# Altium project DC Electronic Load Power MOSFETS.PrjPcb
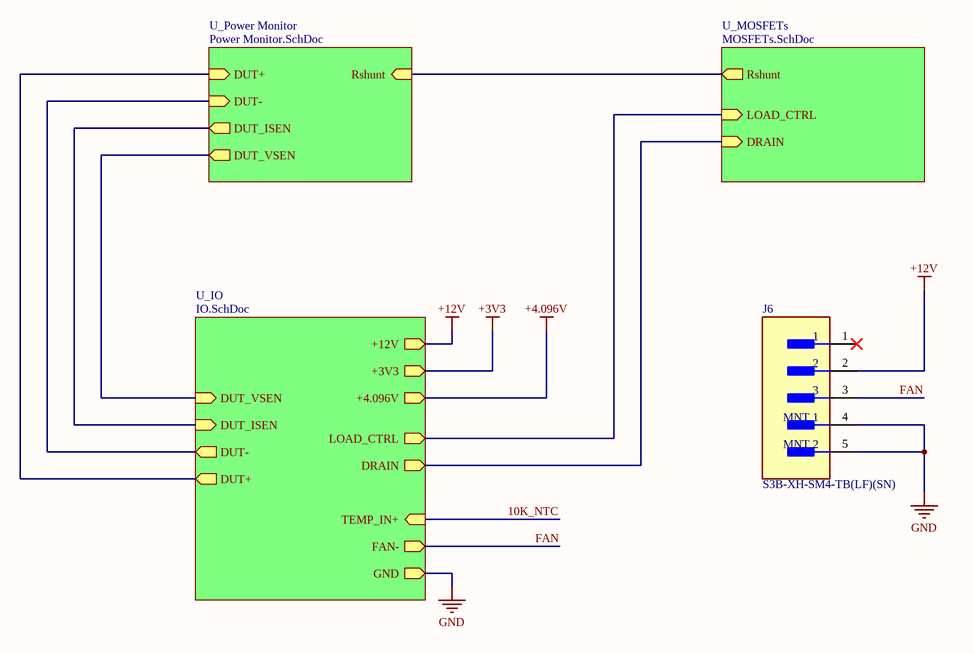
[diagram p0: Top.SchDoc]
4 sheets, 38 parts. Net scope: hierarchical (ports join the sheet entries above them; power ports are global).
Board file: Power Electronics.PcbDoc
Sheets:
  Top.SchDoc
    U_IO = IO.SchDoc
    U_Power Monitor = Power Monitor.SchDoc
    U_MOSFETs = MOSFETs.SchDoc

## Sheet Top.SchDoc
size B; SheetNumber: 1; SheetTotal: 4

### Parts
J6  S3B-XH-SM4-TB(LF)(SN)  [FP-S3B-XH-SM4-TB_LF_SN-MFG]

### Sub-sheets
U_IO = IO.SchDoc: DRAIN (out), DUT+ (out), DUT- (out), DUT_VSEN (in), DUT_ISEN (in), LOAD_CTRL (out), FAN- (out), TEMP_IN+ (in), +4.096V (out), +3V3 (out), +12V (out), GND (out)
U_MOSFETs = MOSFETs.SchDoc: DRAIN (in), LOAD_CTRL (in), Rshunt (out)
U_Power Monitor = Power Monitor.SchDoc: DUT+ (in), DUT- (in), DUT_VSEN (out), DUT_ISEN (out), Rshunt (in)

### Nets
+12V: J6.2 ; sheet U_IO/+12V
GND: J6.4(MNT_1) J6.5(MNT_2) ; sheet U_IO/DUT-, sheet U_IO/GND, sheet U_Power Monitor/DUT-
DUT Input: sheet U_IO/DUT+, sheet U_Power Monitor/DUT+
DUT_ISEN_P: sheet U_Power Monitor/Rshunt, sheet U_MOSFETs/Rshunt
FAN: J6.3 ; sheet U_IO/FAN-
NetP1_5: sheet U_IO/DUT_ISEN, sheet U_Power Monitor/DUT_ISEN
NetP1_6: sheet U_IO/LOAD_CTRL, sheet U_MOSFETs/LOAD_CTRL
NetP1_10: sheet U_IO/DUT_VSEN, sheet U_Power Monitor/DUT_VSEN
NetQ1_2: sheet U_IO/DRAIN, sheet U_MOSFETs/DRAIN

Not connected (* = marked no-connect by the designer): J6 1*

### Library data of the parts
J6 = CMP-17439-000066-1: CONN HEADER SMD R/A 3POS 2.5MM; Number of Positions: 3; Max Current Rating: 3A; Gender: Male; Max Voltage Rating (AC): 250V; Contact Resistance: 20mR; Connector Type: Male Pin; Max Operating Temperature: 85°C; Orientation: Right Angle; Series: XH; Number of Rows: 1; Housing Material: Polyamide; Packaging: Tape and Reel; Number of Contacts: 3; REACH SVHC: No SVHC; Housing Color: Beige; Mount: Surface Mount; Contact Material: Copper Alloy; Package Quantity: 1; Color: Natural; Min Operating Temperature: -25°C; Termination: Solder; Fastening Type: Detent; Pitch: 2.5mm; Lead Free: Lead Free; Length: 12.5mm; Depth: 10mm; Contact Plating: Tin; Contact Type: Male Pin

## Sheet IO.SchDoc
size B; SheetNumber: 4; SheetTotal: 4
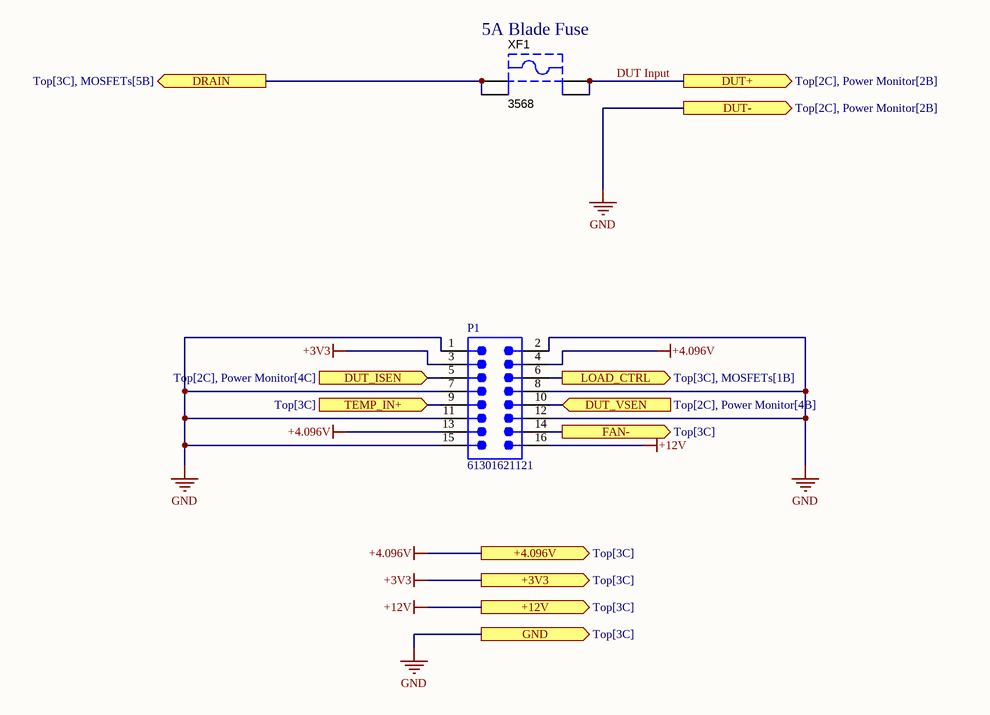
[diagram p1: IO.SchDoc]

### Parts
P1  61301621121  [61301621121]
XF1  3568  [KSTN-3568_V]

### Ports
+3V3 (out, see Top[3C]), +4.096V (out, see Top[3C]), +12V (out, see Top[3C]), DRAIN (out, see Top[3C], MOSFETs[5B]), DUT+ (out, see Top[2C], Power Monitor[2B]), DUT- (out, see Top[2C], Power Monitor[2B]), DUT_ISEN (in, see Top[2C], Power Monitor[4C]), DUT_VSEN (in, see Top[2C], Power Monitor[4B]), FAN- (out, see Top[3C]), GND (out, see Top[3C]), LOAD_CTRL (out, see Top[3C], MOSFETs[1B]), TEMP_IN+ (in, see Top[3C])

### Nets
+3V3: P1.3 ; port +3V3
+4.096V: P1.4 P1.13 ; port +4.096V
+12V: P1.16 ; port +12V
GND: P1.1 P1.2 P1.7 P1.8 P1.11 P1.12 P1.15 ; port DUT-, port GND
10K_NTC: P1.9 ; port TEMP_IN+
DUT Input: XF1.3 XF1.4 ; port DUT+
FAN: P1.14 ; port FAN-
NetP1_5: P1.5 ; port DUT_ISEN
NetP1_6: P1.6 ; port LOAD_CTRL
NetP1_10: P1.10 ; port DUT_VSEN
NetQ1_2: XF1.1 XF1.2 ; port DRAIN

### Notes on the sheet
- (near XF1) 5A Blade Fuse

### Library data of the parts
P1 = CMP-1502-01097-3: NexarPartId: 32855550; Contact Resistance: 20mΩ; Operating Supply Voltage: 250V; Number of Contacts: 16; Current Rating: 3A; Connector Type: Male Pin; Row Spacing: 2.54mm; Gender: Male; Min Operating Temperature: -40°C; Contact Material: Copper; RoHS: Compliant; Lead Pitch: 2.54mm; Color: Black; Contact Mating Length: 5.9944mm; REACH SVHC: Unknown; Number of Rows: 2; Orientation: Vertical; Number of Positions: 16; Max Operating Temperature: 105°C; Termination: Solder; Packaging: Bulk; Height: 8.89mm; Mount: Through Hole; Contact Plating: Gold; Voltage Rating: 250V; Number of Pins: 16; Pitch: 2.54mm
XF1 = CMP-2000-05464-1: JLCPCB: / C19727305 / Fuse Holder, 20 A, 500 V, -50 to 145 degC, 4-Pin THD, RoHS; Manufacturer: Keystone; Package Reference: 3568; Datasheet Version: 04/2013; Datasheet URL: https://datasheet.ciiva.com/16294/m60-2p40-16294706.pdf; Manufacturer URL: http://www.keyelco.com/; Mounting Technology: ThroughHole; Package Description: 4-Pin Through Hole Device, Body 16 x 6.73 mm, Pitch 9.9 mm

## Sheet Power Monitor.SchDoc
size B; SheetNumber: 3; SheetTotal: 4
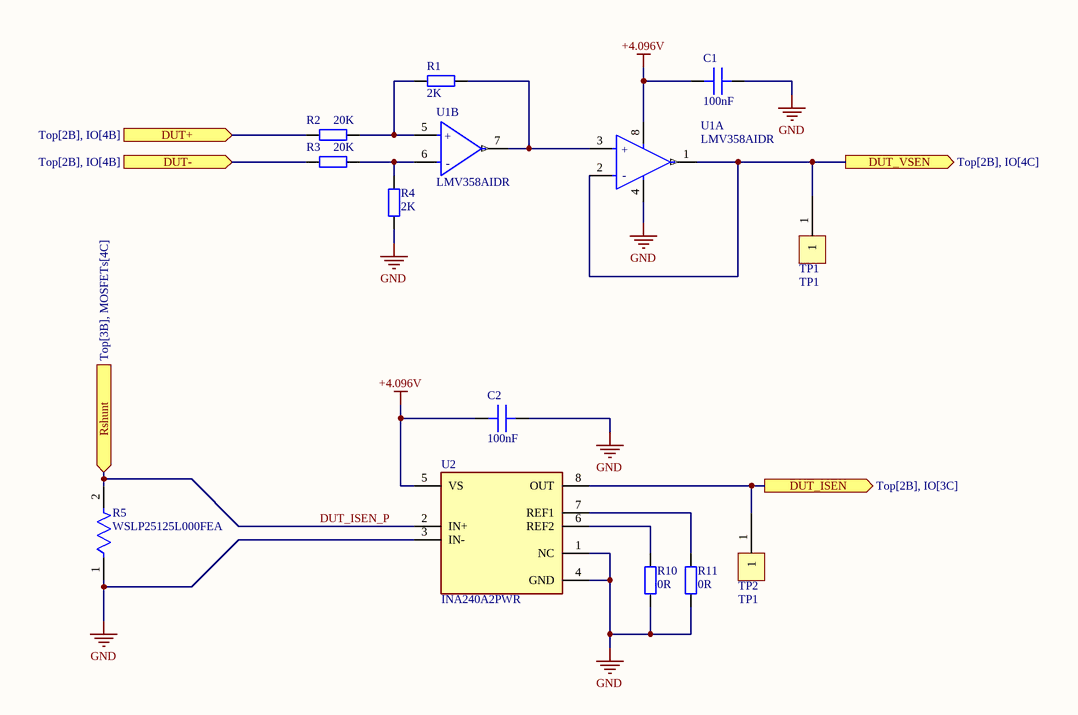
[diagram p2: Power Monitor.SchDoc]

### Parts
C1  100nF  [IPC C C0402 NO SILK]
C2  100nF  [IPC C C0402 NO SILK]
R1  2K  [IPC C R0603 NO SILK]
R2  20K  [IPC C R0603 NO SILK]
R3  20K  [IPC C R0603 NO SILK]
R4  2K  [IPC C R0603 NO SILK]
R5  WSLP25125L000FEA  [FP-WSLP2512-0R005-0R0069-MFG]
R10  0R  [IPC C R0603 NO SILK]
R11  0R  [IPC C R0603 NO SILK]
TP1  TP1  [TP1]
TP2  TP1  [TP1]
U1  LMV358AIDR  [FP-D0008A-IPC_C]  (parts A,B of 2)
U2  INA240A2PWR  [FP-PW0008A-MFG]

### Ports
DUT+ (in, see Top[2B], IO[4B]), DUT- (in, see Top[2B], IO[4B]), DUT_ISEN (out, see Top[2B], IO[3C]), DUT_VSEN (out, see Top[2B], IO[4C]), Rshunt (in, see Top[3B], MOSFETs[4C])

### Nets
+4.096V: C1.2 C2.2 U1.8(V+) U2.5(VS)
GND: C1.1 C2.1 R3.1 R4.2 R5.1 R10.1 R11.1 U1.4(V-) U2.1(NC) U2.3(IN-) U2.4(GND) ; port DUT-
DUT Input: R2.1 ; port DUT+
DUT_ISEN_P: R5.2 U2.2(IN+) ; port Rshunt
NetP1_5: TP2.1 U2.8(OUT) ; port DUT_ISEN
NetP1_10: TP1.1 U1.1(OUT_A) U1.2(-IN_A) ; port DUT_VSEN
NetR1_1: R1.1 R2.2 U1.5(+IN_B)
NetR1_2: R1.2 U1.3(+IN_A) U1.7(OUT_B)
NetR3_2: R3.2 R4.1 U1.6(-IN_B)
NetR10_2: R10.2 U2.6(REF2)
NetR11_2: R11.2 U2.7(REF1)

### Notes on the sheet
- (in symbol CMP-04895-000233-1, part A) +; -
- (in symbol CMP-04895-000233-1, part B) +; -

### Library data of the parts
C1 C2 = CMP-002-000000-1: Source: Schlib1.SchLib; Design Item ID: Generic CAP 0402; Value: 100nF
R1 R4 R10 R11 = CMP-008-000001-2: Generic RES 0603; Design Item ID: Generic RES 0603; Source: Schlib1.SchLib
  R1 R4: Value: 2K
  R10 R11: Value: 0R
R2 R3 = CMP-008-000001-2: Generic RES 0603 / C136942; Value: 20K; Design Item ID: Generic RES 0603; Source: Schlib1.SchLib
R5 = CMP-00030-22061781-1: WSLP25125L000FEA Res Metal Strip 2512 0.005 Ohm 1% 3W ±110ppm/C Sulfur Resistant Pad SMD Automotive T/R; Temperature Coefficient: 110ppm/°C; Resistance: 5mΩ; Max Operating Temperature: 170°C; Height: 635µm; Composition: Metal Element, Metal Strip; Power Rating: 3W; Case Code (Metric): 6432; Width: 3.2mm; Packaging: Cut Tape; Mount: Surface Mount; Lead Free: Lead Free; Case/Package: 2512; Termination: SMD/SMT; Length: 6.4mm; REACH SVHC: Unknown; Tolerance: 1%; NexarPartId: 22061781; Schedule B: 8533210045, 8533210045; RoHS: Compliant; Min Operating Temperature: -65°C; Case Code (Imperial): 2512
TP1 TP2 = CMP-00003-3: Testpoint double sided
U1 = CMP-04895-000233-1: IC OPAMP GP 2 CIRCUIT 8SOIC / C182039; Gain Bandwidth Product: 1MHz; Number of Channels: 2; Input Offset Voltage (Vos): 1mV; Operating Supply Current: 80uA; Input Bias Current: 10pA; Slew Rate: 1.7V/µs; Min Operating Temperature: -40°C; Number of Circuits: 2; Packaging: Cut Tape; Case/Package: SOIC; RoHS Compliant: Yes; Number of Pins: 8; Mount: Surface Mount; Max Operating Temperature: 125°C
U2 = CMP-04895-000047-1: IC AMP CURRENT SENSE 8-TSSOP; Manufacturer: Texas Instruments; Voltage Gain: 0.05V/mV; Max Supply Voltage: 5.5V; Max Junction Temp: +150°C; Input Offset Voltage: 0.005mV; Bandwidth: 400kHz; Min Supply Voltage: 2.7V; Nominal Supply Current: 1.8mA; Standoff Height: 0.05mm; Number Of Channels: 1; Input Bias Current: 90uA; ComponentLink2URL: http://www.ti.com/lit/ds/symlink/ina240.pdf; Device Class L2: Linear ICs; ComponentLink2Description: Datasheet; Temperature: -40°C to +125°C; Octopart: https://octopart.com/ina240a2pwr-texas+instruments-75431049; Automotive: No; Manufacturer Part Number: INA240A2PWR; Ambient Temperature Range Low: -40°C; RoHS: TRUE; Package: PW0008A; Device Class L1: Integrated Circuits (ICs); Temperature Range Low: -40°C; Category: IC; Ipc Land Pattern Name: SOP65P300X120-8; Temperature Range High: +125°C; Ambient Temperature Range High: +125°C; Height: 1.2mm; Lead Free: Yes; Device Class L3: Instrumentation; Digikey Description: IC AMP CURRENT SENSE 8-TSSOP

## Sheet MOSFETs.SchDoc
size B; SheetNumber: 2; SheetTotal: 4
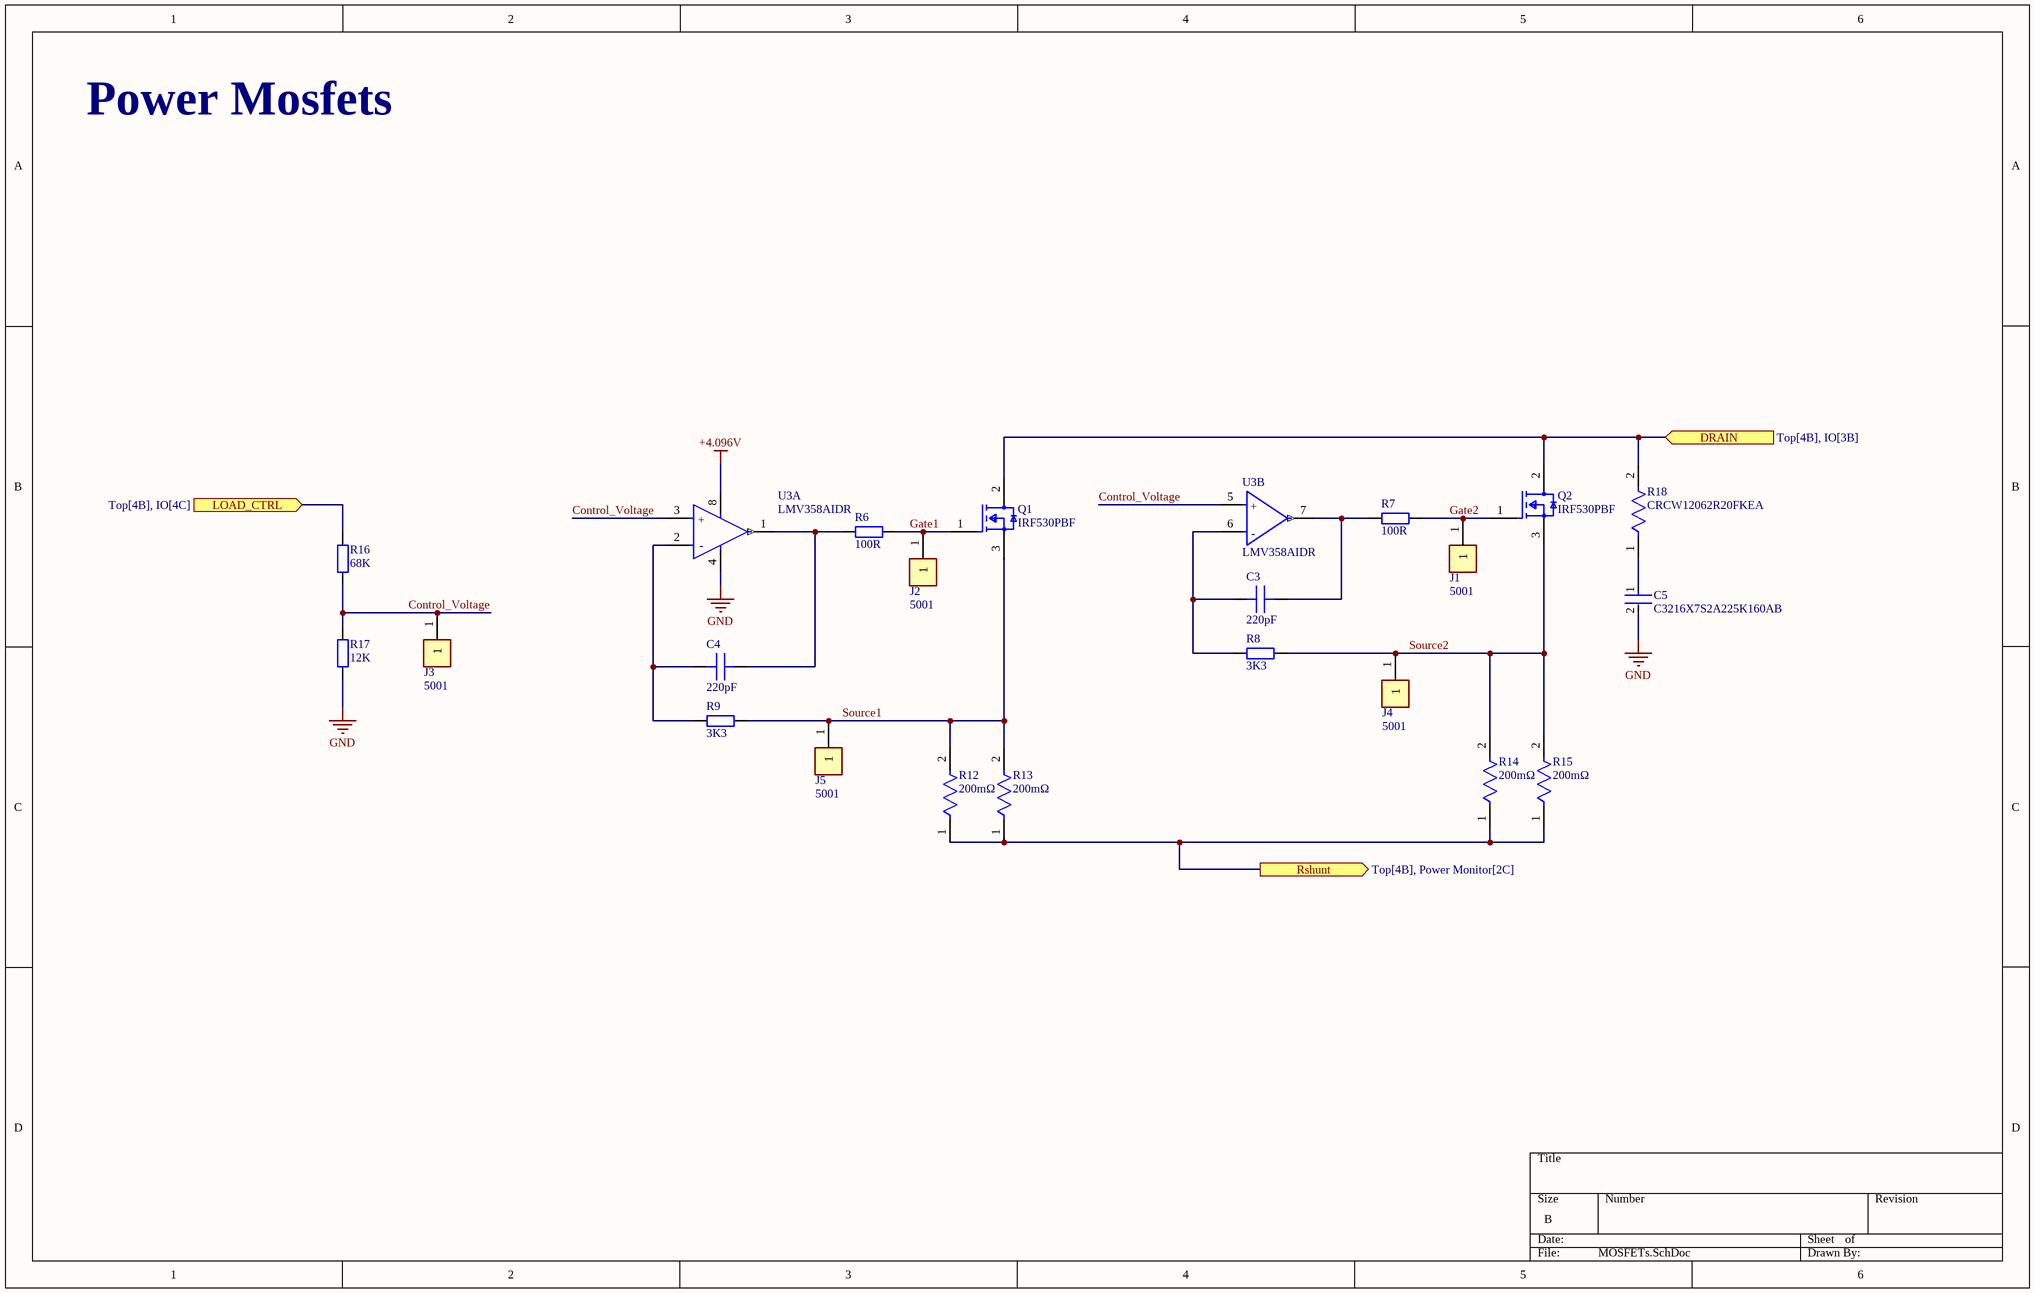
[diagram p3: MOSFETs.SchDoc]

### Parts
C3  220pF  [IPC C C0603 NO SILK]
C4  220pF  [IPC C C0603 NO SILK]
C5  C3216X7S2A225K160AB  [FP-C3216-160-0_2-IPC_B]
J1  5001  [FP-5001-MFG]
J2  5001  [FP-5001-MFG]
J3  5001  [FP-5001-MFG]
J4  5001  [FP-5001-MFG]
J5  5001  [FP-5001-MFG]
Q1  IRF530PBF  [FP-X15-0364-MFG]
Q2  IRF530PBF  [FP-X15-0364-MFG]
R6  100R  [IPC C R0603 NO SILK]
R7  100R  [IPC C R0603 NO SILK]
R8  3K3  [IPC C R0603 NO SILK]
R9  3K3  [IPC C R0603 NO SILK]
R12  200mΩ  [FP-RL2512-MFG]
R13  200mΩ  [FP-RL2512-MFG]
R14  200mΩ  [FP-RL2512-MFG]
R15  200mΩ  [FP-RL2512-MFG]
R16  68K  [IPC C R0603 NO SILK]
R17  12K  [IPC C R0603 NO SILK]
R18  CRCW12062R20FKEA  [FP-CRCW1206-e3-IPC_A]
U3  LMV358AIDR  [FP-D0008A-IPC_C]  (parts A,B of 2)

### Ports
DRAIN (in, see Top[4B], IO[3B]), LOAD_CTRL (in, see Top[4B], IO[4C]), Rshunt (out, see Top[4B], Power Monitor[2C])

### Nets
+4.096V: U3.8(V+)
GND: C5.2 R17.1 U3.4(V-)
Control_Voltage: J3.1 R16.1 R17.2 U3.3(+IN_A) U3.5(+IN_B)
DUT_ISEN_P: R12.1 R13.1 R14.1 R15.1 ; port Rshunt
Gate1: J2.1 Q1.1(G) R6.2
Gate2: J1.1 Q2.1(G) R7.2
Source1: J5.1 Q1.3(S) R9.2 R12.2 R13.2
Source2: J4.1 Q2.3(S) R8.2 R14.2 R15.2
NetC3_1: C3.1 R8.1 U3.6(-IN_B)
NetC3_2: C3.2 R7.1 U3.7(OUT_B)
NetC4_1: C4.1 R9.1 U3.2(-IN_A)
NetC4_2: C4.2 R6.1 U3.1(OUT_A)
NetC5_1: C5.1 R18.1
NetP1_6: R16.2 ; port LOAD_CTRL
NetQ1_2: Q1.2(D) Q2.2(D) R18.2 ; port DRAIN

### Notes on the sheet
- Power Mosfets
- (in symbol CMP-04895-000233-1, part A) +; -
- (in symbol CMP-04895-000233-1, part B) +; -

### Library data of the parts
C3 C4 = CMP-002-000001-1: Generic CAP 0603; Value: 220pF; Source: Schlib1.SchLib; Design Item ID: Generic CAP 0603
C5 = CMP-08246-004303-1: Multilayer Ceramic Capacitors 2.2uF ±10% 100V X7S SMD 1206; Min Operating Temperature: -55°C; Tolerance: 10%; Number of Pins: 2; Case Code (Metric): 3216; REACH SVHC: No SVHC; Package Quantity: 1; Capacitance: 2.2uF; Lead Free: Lead Free; Termination: SMD/SMT; Voltage Rating (DC): 100V; Voltage Rating: 100V; Case Code (Imperial): 1206; Dielectric: X7S; Height: 1.6mm; Packaging: Tape and Reel; Weight: 0.000571oz; Radiation Hardening: No; Mount: Surface Mount; Width: 0.063inch; Length: 3.2mm; Case/Package: 1206; Depth: 1.6mm; RoHS Compliant: Yes; Max Operating Temperature: 125°C; Series: C; Voltage: 100V; Resistor Type: Ceramic; Thickness: 0.071inch; Construction: Flat
J1-J5 = CMP-2000-05181-2: PC TEST POINT MINIATURE BLACK; Body Material: Bronze; Plating: Silver; Inside Diameter: 1.27mm; Hole Diameter: 1.6mm; Number of Ports: 1; Outside Diameter: 2.54mm; Insulation: Insulated; Insulation Material: Nylon; Mount: Through Hole; RoHS Compliant: Yes; Series: THM; Height: 0.3inch; Termination: Through Hole; Material: Nylon; Packaging: Bulk; Contact Material: Bronze; REACH SVHC: No SVHC; Contact Plating: Silver; Orientation: Straight; Lead Free: Lead Free; Package Quantity: 100; Length: 7.62mm; Flammability Rating: UL94 V-0; Number of Contacts: 1; Diameter: 2.54mm; Housing Color: Black; Color: Black
Q1 Q2 = CMP-02550-000190-1: MOSFET N-CH 100V 14A TO-220AB; Manufacturer: Vishay; Reverse Recovery Charge: 850nC; Rthja Max: 62°C/W; Power Dissipation: 88W; Depletion Mode: False; Input Capacitace At Vds: 670pF @ 25V; Pulse Drain Current: 56A; Turn On Delay Time: 10ns; Drain To Source Resistance: 0.16Ω; Number Of N Channels: 1; Max Junction Temp: +175°C; Threshold Vgs Max: 4V; Standoff Height: 3.33mm; Max Forward Diode Voltage: 2.5V; Turn Off Delay Time: 23ns; Gate To Source Voltage: 20V; Threshold Vgs Min: 2V; Reverse Recovery Time: 150ns; Gate Charge At Vgs: 26nC @ 10V; Temperature: -55°C to +175°C; Drain To Source Voltage: 100V; Mouser Description: MOSFET N-Chan 100V 14 Amp; Device Class L2: Transistors; Temperature Range High: +175°C; ComponentLink2URL: http://www.vishay.com/docs/91019/91019.pdf; Lead Free: Yes; Height: 19.89mm; Octopart: https://octopart.com/irf530pbf-vishay-46547999; Category: Trans; ComponentLink2Description: Datasheet; RoHS: TRUE; Device Class L3: MOSFETs; Automotive: No; Device Class L1: Discrete Semiconductors; Package: X15-0364; Manufacturer Part Number: IRF530PBF; Continuous Drain Current: 14A; Digikey Description: MOSFET N-CH 100V 14A TO-220AB; Number Of Channels: 1; Drain To Source Breakdown Voltage: 100V; Temperature Range Low: -55°C
R6-R9 R16 R17 = CMP-008-000001-2: Generic RES 0603; Design Item ID: Generic RES 0603; Source: Schlib1.SchLib
  R6 R7: Value: 100R
  R8 R9: Value: 3K3
  R16: Value: 68K
  R17: Value: 12K
R12-R15 = CMP-03412-002864-1: RES 0.2 OHM 1% 1W 2512 / RL2512FK-070R2L; Manufacturer: Yageo; Temperature Coefficient: 600ppm/°C; Automotive Grade: Grade 0; Category: Res; Manufacturer Part Number: RL2512FK-070R2L; Series: RL; Automotive: Yes; ComponentLink2Description: Datasheet; RoHS: TRUE; Tolerance: 1%; Value: 200mΩ; Octopart: https://octopart.com/rl2512fk-070r2l-yageo-22252310; Power Rating: 1W; Package: RL2512; ComponentLink2URL: http://www.yageo.com/documents/recent/PYu-RL_Group_521_RoHS_L_2.pdf; Footprint Url: http://www.yageo.com/exep/pages/download/literatures/PYu-R_Mount_10.pdf; Ipc Land Pattern Name: RESC635320X55; Device Class L1: Passive Components; Temperature: -55°C to +155°C; Mouser Description: Res Thick Film 2512 0.2 Ohm 1% 1W ±600ppm/C Epoxy Pad SMD Automotive T/R; Height: 0.65mm; Temperature Range High: +155°C; Digikey Description: RES 0.2 OHM 1% 1W 2512; Temperature Range Low: -55°C; Composition: Thick Film; Resistance: 200mΩ; Lead Free: Yes; Device Class L3: Chip SMD Resistors; Device Class L2: Resistors
R18 = CMP-2003-02449-2: RES Thick Film, 2.2Ω, 1%, 0.25W, 100ppm/°C, 1206; Voltage Rating (DC): 200V; Resistance: 2.2R; Max Power Dissipation: 250mW; Features: Automotive AEC-Q200; Number of Terminations: 2; Depth: 1.6mm; Width: 0.063inch; Case Code (Metric): 3216; Packaging: Tape and Reel; Power Rating: 250mW; Voltage Rating: 200V; Temperature Coefficient: 100ppm/°C; Package Quantity: 10; Contact Plating: Tin; Military Standard: Not; Lead Free: Lead Free; Composition: Thick Film; Case/Package: 1206; Height: 0.55mm; Max Operating Temperature: 155°C; Length: 3.2mm; Number of Pins: 2; Radiation Hardening: No; Case Code (Imperial): 1206; Tolerance: 1%; Termination: SMD/SMT; Weight: 0.000353oz; Min Operating Temperature: -55°C
U3 = CMP-04895-000233-1: IC OPAMP GP 2 CIRCUIT 8SOIC; Gain Bandwidth Product: 1MHz; Number of Channels: 2; Input Offset Voltage (Vos): 1mV; Operating Supply Current: 80uA; Input Bias Current: 10pA; Slew Rate: 1.7V/µs; Min Operating Temperature: -40°C; Number of Circuits: 2; Packaging: Cut Tape; Case/Package: SOIC; RoHS Compliant: Yes; Number of Pins: 8; Mount: Surface Mount; Max Operating Temperature: 125°C

## Nets that join several sheets
+4.096V: IO (P1.4 P1.13), Power Monitor (C1.2 C2.2 U1.8 U2.5), MOSFETs (U3.8)
+12V: Top (J6.2), IO (P1.16)
GND: Top (J6.4 J6.5), IO (7 pins), Power Monitor (11 pins), MOSFETs (C5.2 R17.1 U3.4)
DUT Input: IO (XF1.3 XF1.4), Power Monitor (R2.1)
DUT_ISEN_P: Power Monitor (R5.2 U2.2), MOSFETs (R12.1 R13.1 R14.1 R15.1)
FAN: Top (J6.3), IO (P1.14)
NetP1_5: IO (P1.5), Power Monitor (TP2.1 U2.8)
NetP1_6: IO (P1.6), MOSFETs (R16.2)
NetP1_10: IO (P1.10), Power Monitor (TP1.1 U1.1 U1.2)
NetQ1_2: IO (XF1.1 XF1.2), MOSFETs (Q1.2 Q2.2 R18.2)